# Altium project Moduloa_DRV.PrjPcb
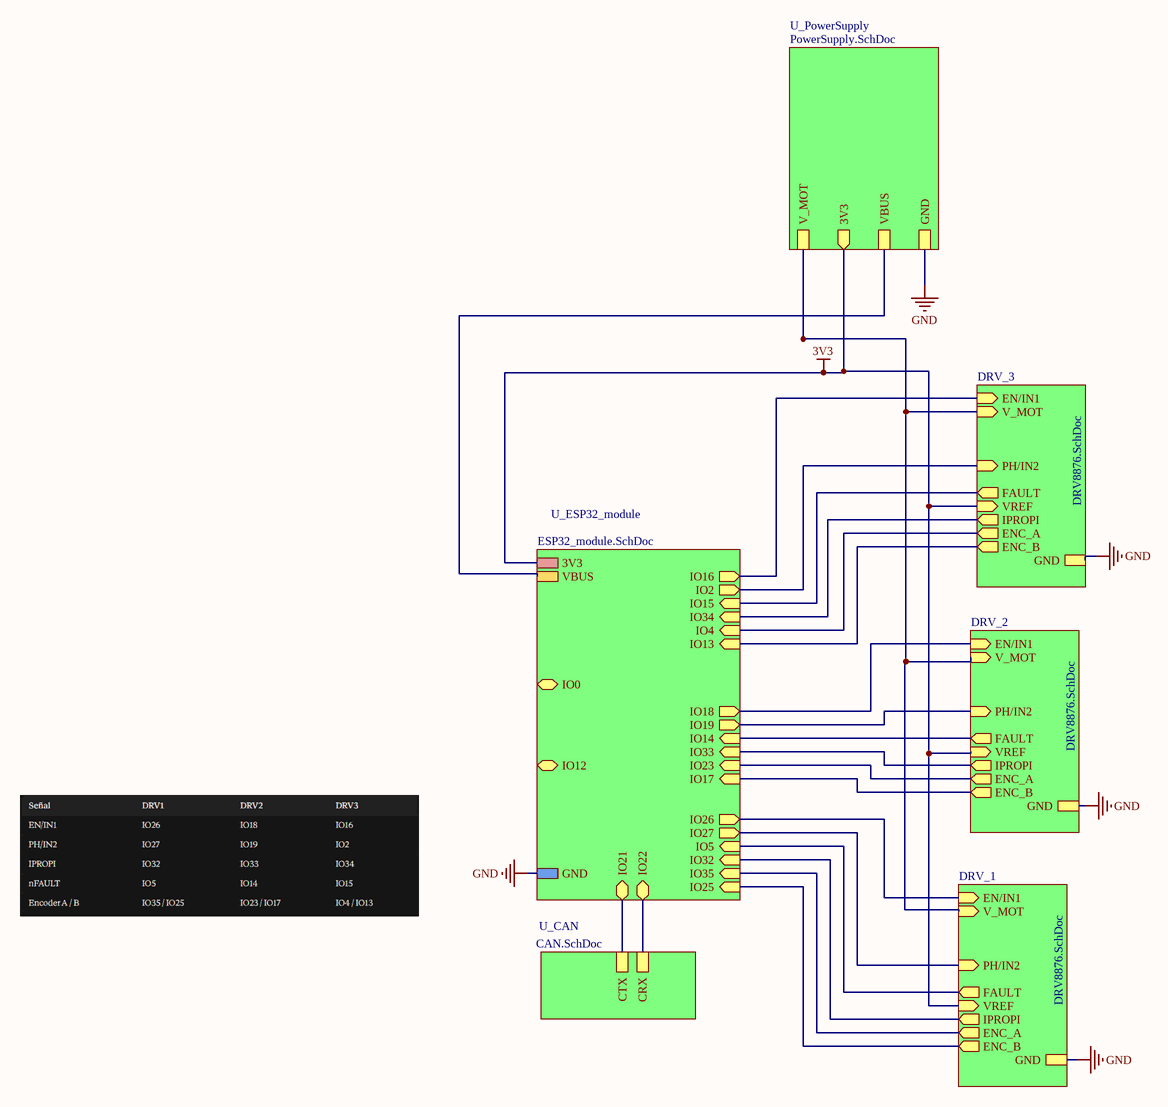
[diagram p0: MOD_DRV.SchDoc]
5 sheets, 88 parts. Net scope: hierarchical (ports join the sheet entries above them; power ports are global).
Board file: MOD_DRV.PcbDoc
Sheets:
  MOD_DRV.SchDoc
    U_ESP32_module = ESP32_module.SchDoc
    DRV_3 = DRV8876.SchDoc
    DRV_2 = DRV8876.SchDoc
    DRV_1 = DRV8876.SchDoc
    U_PowerSupply = PowerSupply.SchDoc
    U_CAN = CAN.SchDoc

## Sheet MOD_DRV.SchDoc: AAA
size 431 x 279 mm; Organization: AleskyINC; Address1: ADDRESS 1; Address2: ADDRESS 2; Address3: ADDRESS 3; Address4: ADDRESS 4; Revision: -; SheetNumber: 1; SheetTotal: 5; ENG_APP_DATE: --/--/--; DSN_APP_DATE: --/--/--; CHK_APP_DATE: --/--/--

### Sub-sheets
DRV_1 = DRV8876.SchDoc: EN/IN1 (in), PH/IN2 (in), FAULT (out), IPROPI (out), V_MOT (in), GND, VREF (in), ENC_A (out), ENC_B (out)
DRV_2 = DRV8876.SchDoc: EN/IN1 (in), PH/IN2 (in), FAULT (out), IPROPI (out), V_MOT (in), GND, VREF (in), ENC_A (out), ENC_B (out)
DRV_3 = DRV8876.SchDoc: EN/IN1 (in), PH/IN2 (in), FAULT (out), IPROPI (out), V_MOT (in), GND, VREF (in), ENC_B (out), ENC_A (out)
U_CAN = CAN.SchDoc: CTX, CRX
U_ESP32_module = ESP32_module.SchDoc: IO0 (bidir), IO2 (out), IO4 (in), IO5 (in), IO12 (bidir), IO13 (in), IO14 (in), IO15 (in), IO16 (out), IO17 (in), IO18 (out), IO19 (out), IO21 (bidir), IO22 (bidir), IO23 (in), IO25 (in), IO26 (out), IO27 (out), IO32 (in), IO34 (in), IO35 (in), 3V3, GND, VBUS, IO33 (in)
U_PowerSupply = PowerSupply.SchDoc: V_MOT, 3V3 (out), GND, VBUS

### Nets
3V3: sheet U_ESP32_module/3V3, sheet DRV_3/VREF, sheet DRV_2/VREF, sheet DRV_1/VREF, sheet U_PowerSupply/3V3
GND: sheet U_ESP32_module/GND, sheet DRV_3/GND, sheet DRV_2/GND, sheet DRV_1/GND, sheet U_PowerSupply/GND
V_MOT: sheet DRV_3/V_MOT, sheet DRV_2/V_MOT, sheet DRV_1/V_MOT, sheet U_PowerSupply/V_MOT
VBUS: sheet U_ESP32_module/VBUS, sheet U_PowerSupply/VBUS
IO2: sheet U_ESP32_module/IO2, sheet DRV_3/PH/IN2
IO4: sheet U_ESP32_module/IO4, sheet DRV_3/ENC_A
IO5: sheet U_ESP32_module/IO5, sheet DRV_1/FAULT
IO13: sheet U_ESP32_module/IO13, sheet DRV_3/ENC_B
IO14: sheet U_ESP32_module/IO14, sheet DRV_2/FAULT
IO15: sheet U_ESP32_module/IO15, sheet DRV_3/FAULT
IO16: sheet U_ESP32_module/IO16, sheet DRV_3/EN/IN1
IO17: sheet U_ESP32_module/IO17, sheet DRV_2/ENC_B
IO18: sheet U_ESP32_module/IO18, sheet DRV_2/EN/IN1
IO19: sheet U_ESP32_module/IO19, sheet DRV_2/PH/IN2
IO21: sheet U_ESP32_module/IO21, sheet U_CAN/CTX
IO22: sheet U_ESP32_module/IO22, sheet U_CAN/CRX
IO23: sheet U_ESP32_module/IO23, sheet DRV_2/ENC_A
IO25: sheet U_ESP32_module/IO25, sheet DRV_1/ENC_B
IO26: sheet U_ESP32_module/IO26, sheet DRV_1/EN/IN1
IO27: sheet U_ESP32_module/IO27, sheet DRV_1/PH/IN2
IO32: sheet U_ESP32_module/IO32, sheet DRV_1/IPROPI
IO33: sheet U_ESP32_module/IO33, sheet DRV_2/IPROPI
IO34: sheet U_ESP32_module/IO34, sheet DRV_3/IPROPI
IO35: sheet U_ESP32_module/IO35, sheet DRV_1/ENC_A

### Notes on the sheet
- DWG. NO.
- REV.
- SHT.
- THIS DOCUMENT AND THE DATA DISCLOSED HEREIN OR HEREWITH IS THE PROPERTY OF ALTIUM LIMITED AND MAY BE FREELY DISTRIBUTED IN WHOLE. NO RIGHTS ARE RESERVED OR EXPRESS OR IMPLIED WARANTEE GIVEN.
- REVISION
- DESCRIPTION
- DATE
- APPROVED
- ENG:
- APPROVALS
- PROJECT
- DSN:
- CHK:
- REFERENCE DOCUMENTS
- PROJECT REVISION:
- TITLE
- DOCUMENT REVISION:
- DESIGN ITEM:
- BOM:
- FAB DWG:
- PCB DWG:
- ASSY DWG:
- SCALE:
- SIZE
- B
- CAGE CODE
- FILE NAME
- DWG NO.
- SHEET
- OF
- REV

## Sheet ESP32_module.SchDoc
size 431 x 279 mm; Organization: ORGANIZATION; Address1: ADDRESS 1; Address2: ADDRESS 2; Address3: ADDRESS 3; Address4: ADDRESS 4; Revision: -; SheetNumber: 2; SheetTotal: 5; ENG_APP_DATE: --/--/--; DSN_APP_DATE: --/--/--; CHK_APP_DATE: --/--/--
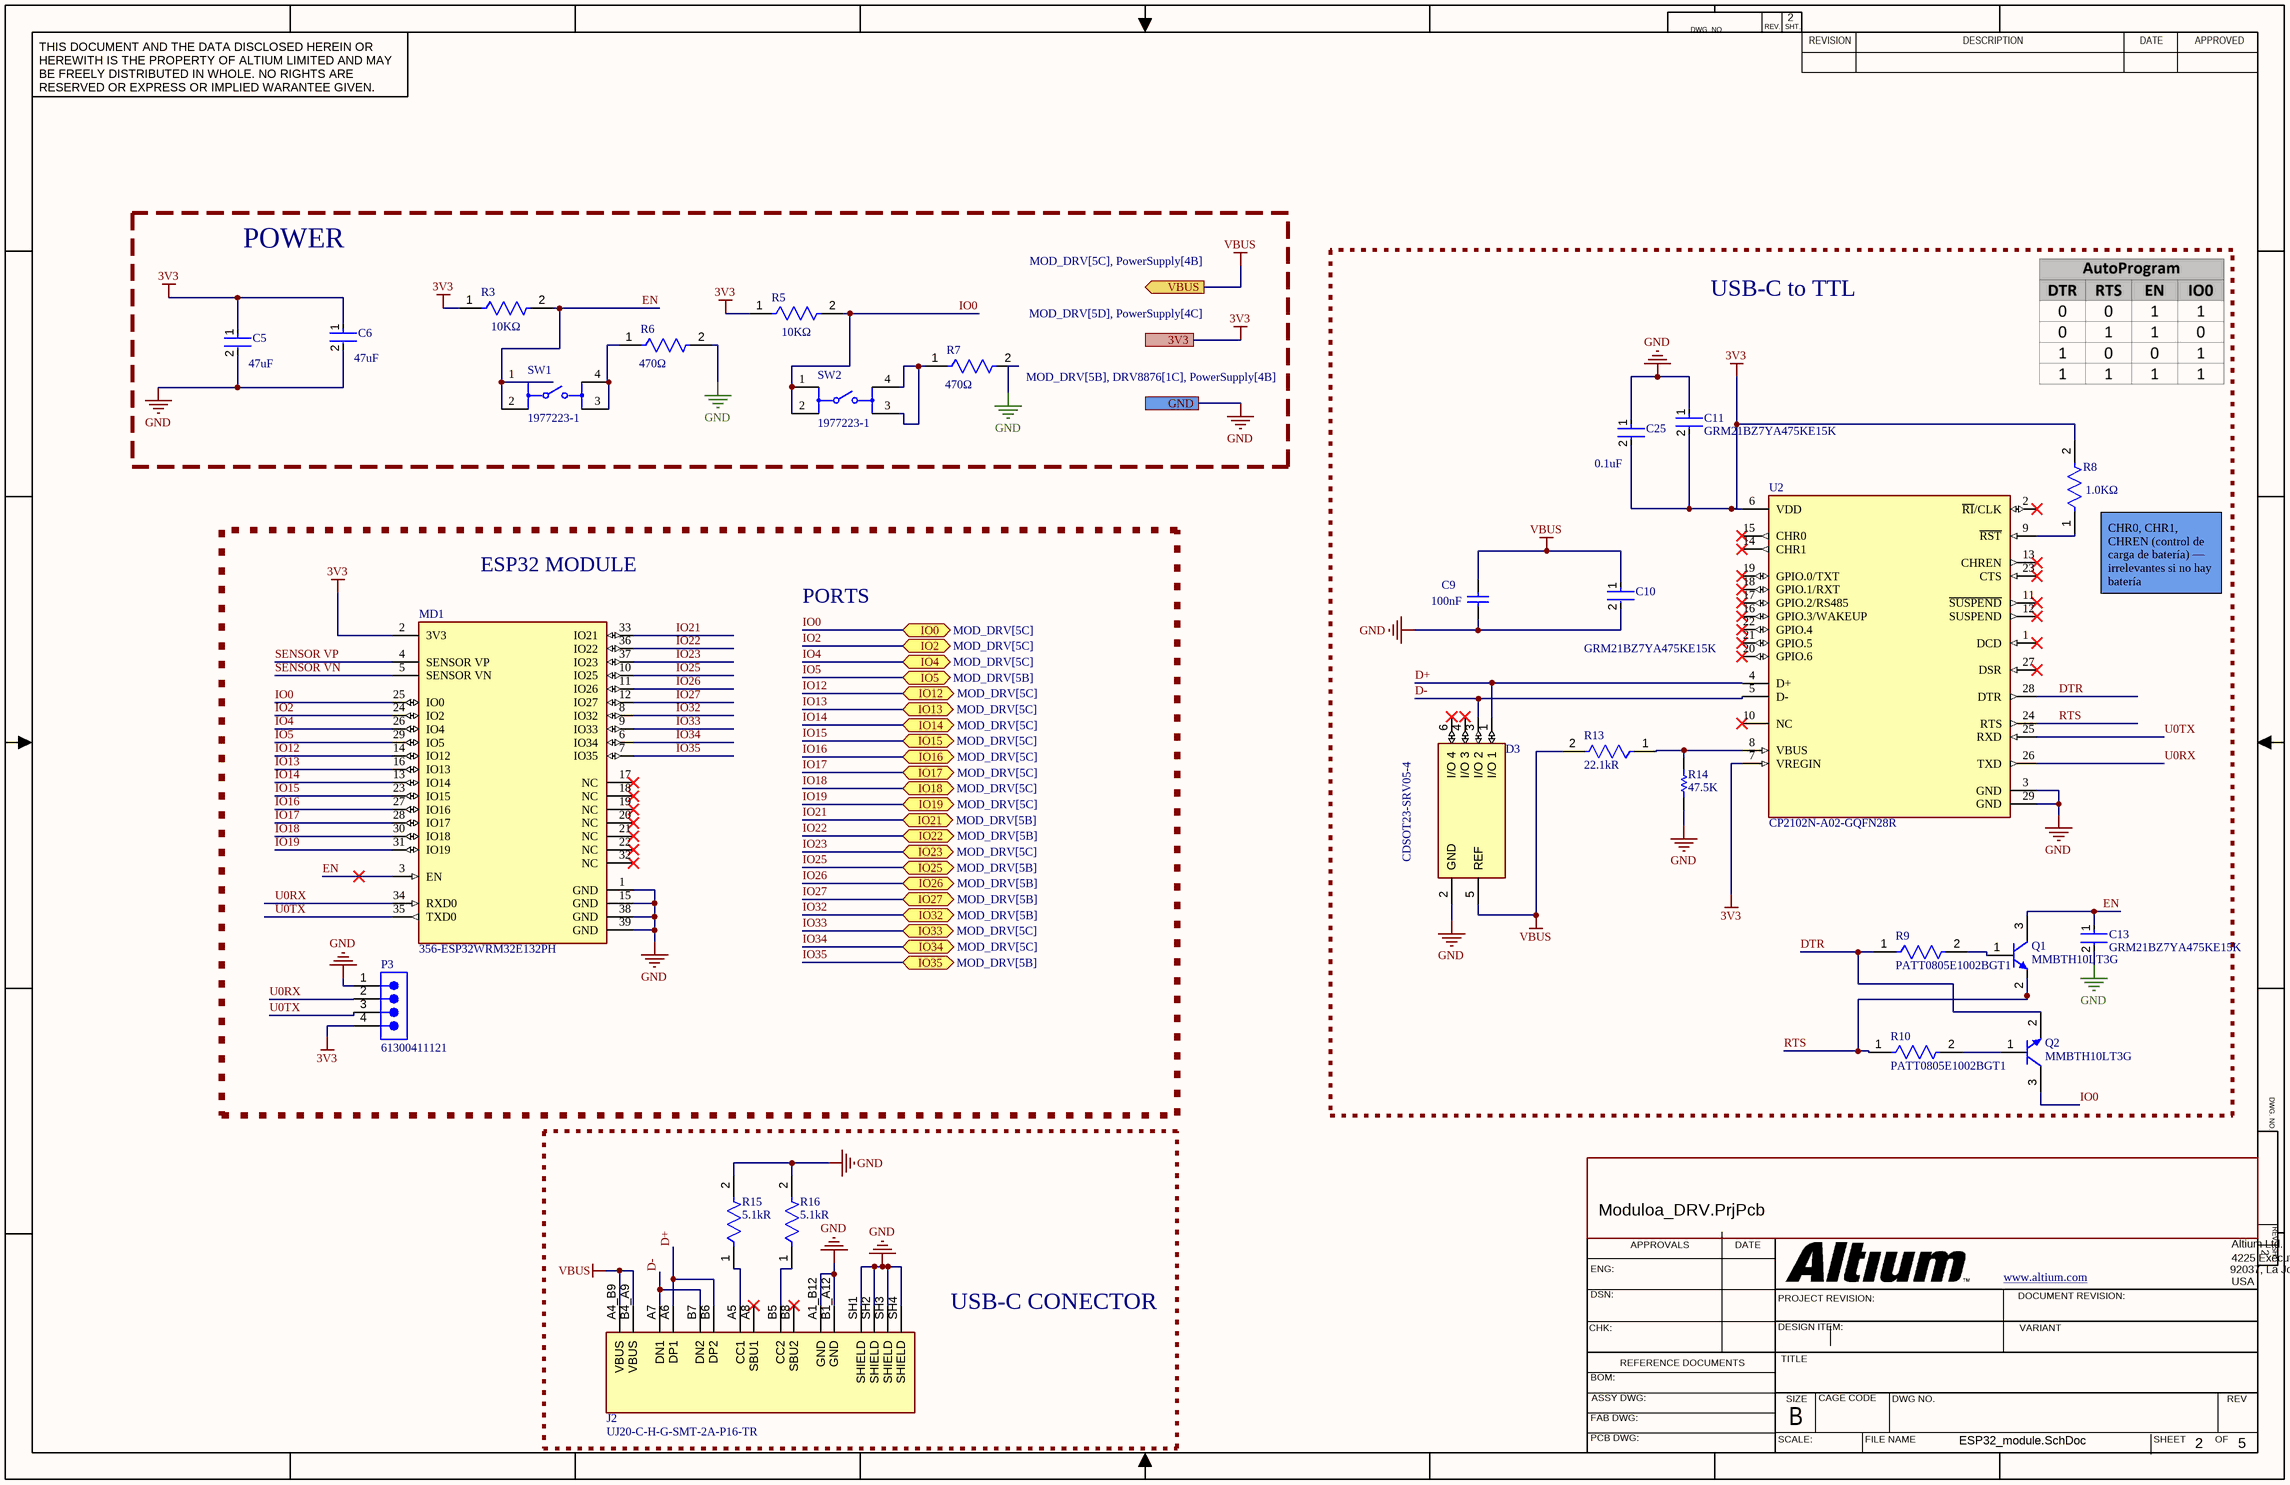
[diagram p1: ESP32_module.SchDoc]

### Parts
C5  Capacitance: 47uF  [FP-GRM31C-0_3-IPC_C]  (hidden comment: GRM31CR61E476ME44L)
C6  Capacitance: 47uF  [FP-GRM31C-0_3-IPC_C]  (hidden comment: GRM31CR61E476ME44L)
C9  100nF  [CAPC2013X145X50NL20T25]
C10  GRM21BZ7YA475KE15K  [FP-GRM21B-0_2-e0_2_0_7-IPC_A]
C11  GRM21BZ7YA475KE15K  [FP-GRM21B-0_2-e0_2_0_7-IPC_A]
C13  GRM21BZ7YA475KE15K  [FP-GRM21B-0_2-e0_2_0_7-IPC_A]
C25  Parameter 1: 0.1uF  [FP-GRM155-0_05-MFG]  (hidden comment: GRM155R71H104KE14D)
D3  CDSOT23-SRV05-4  [FP-CDSOT23-SRV05-4-MFG]
J2  UJ20-C-H-G-SMT-2A-P16-TR  [SAMESKY_UJ20-C-H-G-SMT-2A-P16-TR]
MD1  356-ESP32WRM32E132PH  [FP-ESP32-WROOM-32E_4MB-MFG]
P3  61300411121  [61300411121]
Q1  MMBTH10LT3G  [ONSC-SOT-23-3-318-08_V]
Q2  MMBTH10LT3G  [ONSC-SOT-23-3-318-08_V]
R3  value 10KΩ  [FP-RT0805-MFG]  (hidden comment: RT0805FRD0710KL)
R5  value 10KΩ  [FP-RT0805-MFG]  (hidden comment: RT0805FRD0710KL)
R6  value 470Ω  [FP-AC0805-MFG]  (hidden comment: AC0805FR-07470RL)
R7  value 470Ω  [FP-AC0805-MFG]  (hidden comment: AC0805FR-07470RL)
R8  value 1.0KΩ  [FP-RP732B-MFG]  (hidden comment: RP73D2B1K0BTDF)
R9  PATT0805E1002BGT1  [FP-PATT0805-MFG]
R10  PATT0805E1002BGT1  [FP-PATT0805-MFG]
R13  Resistance: 22.1kR  [FP-RN732A-IPC_C]  (hidden comment: RN732ATTDK2212B25)
R14  47.5K  [RESC1005X40X25NL10T10]
R15  Resistance: 5.1kR  [FP-AC0603-IPC_C]  (hidden comment: AC0603JR-075K1L)
R16  Resistance: 5.1kR  [FP-AC0603-IPC_C]  (hidden comment: AC0603JR-075K1L)
SW1  1977223-1  [FP-1977223-1-MFG]
SW2  1977223-1  [FP-1977223-1-MFG]
U2  CP2102N-A02-GQFN28R  [FP-CP2102N-A02-GQFN28R-MFG]

### Blocks framed on the sheet
POWER: C5 C6 R3 R5-R7 SW1 SW2
USB-C to TTL: C9-C11 C13 C25 D3 Q1 Q2 R8-R10 R13 R14 U2
USB-C CONECTOR: J2 R15 R16

### Ports
3V3 (see MOD_DRV[5D], PowerSupply[4C]), GND (see MOD_DRV[5B], DRV8876[1C], PowerSupply[4B]), IO0 (bidir, see MOD_DRV[5C]), IO2 (bidir, see MOD_DRV[5C]), IO4 (bidir, see MOD_DRV[5C]), IO5 (bidir, see MOD_DRV[5B]), IO12 (bidir, see MOD_DRV[5C]), IO13 (bidir, see MOD_DRV[5C]), IO14 (bidir, see MOD_DRV[5C]), IO15 (bidir, see MOD_DRV[5C]), IO16 (bidir, see MOD_DRV[5C]), IO17 (bidir, see MOD_DRV[5C]), IO18 (bidir, see MOD_DRV[5C]), IO19 (bidir, see MOD_DRV[5C]), IO21 (bidir, see MOD_DRV[5B]), IO22 (bidir, see MOD_DRV[5B]), IO23 (bidir, see MOD_DRV[5C]), IO25 (bidir, see MOD_DRV[5B]), IO26 (bidir, see MOD_DRV[5B]), IO27 (bidir, see MOD_DRV[5B]), IO32 (bidir, see MOD_DRV[5B]), IO33 (bidir, see MOD_DRV[5C]), IO34 (bidir, see MOD_DRV[5C]), IO35 (bidir, see MOD_DRV[5B]), VBUS (out, see MOD_DRV[5C], PowerSupply[4B])

### Nets
3V3: C5.1 C6.1 C11.2 C25.2 MD1.2(3V3) P3.4 R3.1 R5.1 R8.2 U2.6(VDD) U2.7(VREGIN) ; port 3V3
GND: C5.2 C6.2 C9.1 C10.2 C11.1 C13.2 C25.1 D3.2(GND) J2.A1_B12(GND) J2.B1_A12(GND) J2.SH1(SHIELD) J2.SH2(SHIELD) J2.SH3(SHIELD) J2.SH4(SHIELD) MD1.1(GND) MD1.15(GND) MD1.38(GND) MD1.39(GND) P3.1 R6.2 R7.2 R14.1 R15.2 R16.2 U2.3(GND) U2.29(GND) ; port GND
VBUS: C9.2 C10.1 D3.5(REF) J2.A4_B9(VBUS) J2.B4_A9(VBUS) R13.2 ; port VBUS
D+: D3.1(I/O_1) J2.A6(DP1) J2.B6(DP2) U2.4(D+)
D-: D3.3(I/O_2) J2.A7(DN1) J2.B7(DN2) U2.5(D-)
DTR: Q2.2(E) R9.1 U2.28(DTR)
EN: C13.1 MD1.3(EN) Q1.3(C) R3.2 SW1.1 SW1.2
IO0: MD1.25(IO0) Q2.3(C) R5.2 SW2.1 SW2.2 ; port IO0
IO2: MD1.24(IO2) ; port IO2
IO4: MD1.26(IO4) ; port IO4
IO5: MD1.29(IO5) ; port IO5
IO12: MD1.14(IO12) ; port IO12
IO13: MD1.16(IO13) ; port IO13
IO14: MD1.13(IO14) ; port IO14
IO15: MD1.23(IO15) ; port IO15
IO16: MD1.27(IO16) ; port IO16
IO17: MD1.28(IO17) ; port IO17
IO18: MD1.30(IO18) ; port IO18
IO19: MD1.31(IO19) ; port IO19
IO21: MD1.33(IO21) ; port IO21
IO22: MD1.36(IO22) ; port IO22
IO23: MD1.37(IO23) ; port IO23
IO25: MD1.10(IO25) ; port IO25
IO26: MD1.11(IO26) ; port IO26
IO27: MD1.12(IO27) ; port IO27
IO32: MD1.8(IO32) ; port IO32
IO33: MD1.9(IO33) ; port IO33
IO34: MD1.6(IO34) ; port IO34
IO35: MD1.7(IO35) ; port IO35
RTS: Q1.2(E) R10.1 U2.24(RTS)
SENSOR VN: MD1.5(SENSOR_VN)
SENSOR VP: MD1.4(SENSOR_VP)
U0RX: MD1.34(RXD0) P3.2 U2.26(TXD)
U0TX: MD1.35(TXD0) P3.3 U2.25(RXD)
NetJ2_A5: J2.A5(CC1) R15.1
NetJ2_B5: J2.B5(CC2) R16.1
NetQ1_1: Q1.1(B) R9.2
NetQ2_1: Q2.1(B) R10.2
NetR6_1: R6.1 SW1.3 SW1.4
NetR7_1: R7.1 SW2.3 SW2.4
NetR8_1: R8.1 U2.9(~{RST})
NetR13_1: R13.1 R14.2 U2.8(VBUS)

Not connected (* = marked no-connect by the designer): D3 4(I/O_3)* 6(I/O_4)*; J2 A8(SBU1)* B8(SBU2)*; MD1 17(NC)* 18(NC)* 19(NC)* 20(NC)* 21(NC)* 22(NC)* 32(NC)*; U2 1(DCD)* 2(~{RI}/CLK)* 10(NC)* 11(~{SUSPEND})* 12(SUSPEND)* 13(CHREN)* 14(CHR1)* 15(CHR0)* 16(GPIO.3/WAKEUP)* 17(GPIO.2/RS485)* 18(GPIO.1/RXT)* 19(GPIO.0/TXT)* 20(GPIO.6)* 21(GPIO.5)* 22(GPIO.4)* 23(CTS)* 27(DSR)*

### Notes on the sheet
- ESP32 MODULE
- PORTS
- (near R8) CHR0, CHR1, CHREN (control de carga de batería) — irrelevantes si no hay batería
- DWG. NO.
- REV.
- SHT.
- THIS DOCUMENT AND THE DATA DISCLOSED HEREIN OR HEREWITH IS THE PROPERTY OF ALTIUM LIMITED AND MAY BE FREELY DISTRIBUTED IN WHOLE. NO RIGHTS ARE RESERVED OR EXPRESS OR IMPLIED WARANTEE GIVEN.
- REVISION
- DESCRIPTION
- DATE
- APPROVED
- ENG:
- DSN:
- APPROVALS
- PROJECT REVISION:
- www.altium.com <http://www.altium.com>
- DOCUMENT REVISION:
- 92037, La Jolla
- USA
- Altium Ltd.
- 4225 Executive Square
- CHK:
- REFERENCE DOCUMENTS
- DESIGN ITEM:
- TITLE
- VARIANT
- BOM:
- FAB DWG:
- PCB DWG:
- ASSY DWG:
- SCALE:
- SIZE
- B
- CAGE CODE
- FILE NAME
- DWG NO.
- SHEET
- OF
- REV

### Library data of the parts
C5 C6 = CMP-06035-000147-1: CAP CER 47UF 25V X5R 1206-GRM31CR61E476ME44L; Tolerance: 20%; Width: 1.6mm; Dielectric: X5R; Thickness: 1.6mm; Length: 3.2mm; Voltage Rating (DC): 25V
C9 = CMP-2007-01227-1: C0805S104K5RACTU; Manufacturer: Kemet; Part Number: C0805S104K5RACTU
C10 = CMP-06035-048385-1: Chip Multilayer Ceramic Capacitors for General Purpose, 0805, 4.7uF, X7R, 15%, 10%, 35V. GRM21BZ7YA475KE15K
C11 = CMP-06035-048385-1: Chip Multilayer Ceramic Capacitors for General Purpose, 0805, 4.7uF, X7R, 15%, 10%, 35V-GRM21BZ7YA475KE15K
C13 = CMP-06035-048385-1: Chip Multilayer Ceramic Capacitors for General Purpose, 0805, 4.7uF, X7R, 15%, 10%, 35V
C25 = CMP-06035-062118-1: Chip Multilayer Ceramic Capacitors for General Purpose, 0402, 0.10uF, X7R, 15%, 20%, 50V; RoHS Compliant: Yes
D3 = CMP-07401-000007-1: TVS DIODE 5V 15V SOT23-6; Manufacturer: Bourns Inc.; Standoff Height: 0.2mm; Direction: Bidirectional; Peak Pulse Power: 500W; Max Junction Temp: +150°C; Number Of Channels: 4; Breakdown Voltage: 6V; Peak Pulse Current: 30A; Temperature Range High: +150°C; RoHS: TRUE; Category: Diode; Clamping Voltage: 15V; Reverse Standoff Voltage: 5V; Manufacturer Part Number: CDSOT23-SRV05-4; Octopart: https://octopart.com/cdsot23-srv05-4-bourns-1679449; Automotive: No; ComponentLink2URL: https://www.bourns.com/docs/Product-Datasheets/CDSOT23-SRV05-4.pdf; Device Class L1: Circuit Protection; Temperature: -55°C to +150°C; Device Class L2: TVS Diodes; Temperature Range Low: -55°C; Lead Free: Yes; Device Class L3: unset; Height: 1.45mm; Package: CDSOT23-SRV05-4; Ipc Land Pattern Name: SOT95P280X118-6; Mouser Description: CDSOT23-SRV05-4, Quad Uni-Directional TVS Diode, 500W, 6-Pin SOT-23; ComponentLink2Description: Datasheet; Digikey Description: TVS DIODE 5V 15V SOT23-6
MD1 = CMP-194065-000026-1: RX TXRX MOD WIFI TRACE ANT SMD
P3 = CMP-1502-01064-4: THT Vertical Pin Header WR-PHD, Pitch 2.54 mm, Single Row, 4 pins; Connector Type: Male Pin; Gender: Male; Current Rating: 3A; Number of Positions: 4; Operating Supply Voltage: 250V; Contact Resistance: 20mΩ; Pitch: 2.54mm; Max Operating Temperature: 105°C; Mount: Through Hole; Contact Material: Gold; Contact Plating: Gold; Number of Contacts: 4; Orientation: Vertical; Packaging: Bulk; Contact Mating Length: 5.9944mm; Voltage Rating: 250V; Number of Rows: 1; Height: 8.89mm; Lead Free: Lead Free; Lead Pitch: 2.54mm; Number of Pins: 4; Color: Black; Min Operating Temperature: -40°C; RoHS: Compliant; Termination: Solder
Q1 Q2 = CMP-1048-00599-1: VHF / UHF Transistor, NPN Silicon, 3-Pin SOT-23, Pb-Free, Tape and Reel; Manufacturer: On Semiconductor; fT Min (MHz): 650; Packing: Tape and Reel; ComponentLink3Description: Package Specification; PartNumber: MMBTH10LT3G; DatasheetVersion: Rev. 5; Polarity: NPN; ComponentLink2Description: Datasheet; ComponentLink1Description: Manufacturer URL; PackageVersion: Rev. AP, 11/2009; ComponentLink1URL: http://www.onsemi.com/; ComponentLink2URL: http://www.onsemi.cn/pub_link/Collateral/MMBTH10LT1-D.PDF; PackageReference: SOT-23-3-318-08; RoHS: TRUE; Mounting Technology: Surface Mount; ComponentLink3URL: http://www.onsemi.cn/pub_link/Collateral/318-08.PDF; PackageDescription: 3-Pin Small Outline Transistor, Body 2.92 x 1.3 mm, Pitch 0.95 mm
R3 R5 = CMP-03412-035478-1: RES SMD 10K OHM 1% 1/8W 0805; Manufacturer: Yageo; Tolerance: 0.0001; Temperature Coefficient: 25 ppm/°C; Power Rating: 0.125W; Voltage Rating: 150V; RoHS: TRUE; Footprint Url: http://www.yageo.com/exep/pages/download/literatures/PYu-R_Mount_10.pdf; Series: RT; Octopart: https://octopart.com/rt0805frd0710kl-yageo-71399701; Digikey Description: RES SMD 10K OHM 1% 1/8W 0805; Composition: Thin Film; Manufacturer Part Number: RT0805FRD0710KL; Device Class L1: Passive Components; Automotive: No; ComponentLink2Description: Datasheet; Ipc Land Pattern Name: RESC200125X50; Device Class L2: Resistors; Resistance: 10KΩ; Temperature Range Low: -55°C; Device Class L3: Chip SMD Resistors; ComponentLink2URL: http://www.yageo.com/documents/recent/PYu-RT_1-to-0.01_RoHS_L_9.pdf; Temperature: -55°C to +155°C; Category: Res; Temperature Range High: +155°C; Lead Free: Yes; Package: RT0805; Height: 0.6mm
R6 R7 = CMP-03412-037267-1: RES SMD 470 OHM 1% 1/8W 0805; Manufacturer: Yageo; Automotive Grade: Grade 0; Tolerance: 0.01; Voltage Rating: 150V; Package: AC0805; Device Class L3: Chip SMD Resistors; Composition: Thick Film; Ipc Land Pattern Name: RESC200125X50; Height: 0.6mm; Device Class L1: Passive Components; Series: AC; Resistance: 470Ω; RoHS: TRUE; Automotive: Yes; ComponentLink2Description: Datasheet; Power Rating: 1/8W; Temperature Range Low: -55°C; Category: Res; Digikey Description: RES SMD 470 OHM 1% 1/8W 0805; Temperature: -55°C to +155°C; ComponentLink2URL: http://www.yageo.com/documents/recent/PYu-AC_51_RoHS_L_6.pdf; Manufacturer Part Number: AC0805FR-07470RL; Mouser Description: Thick Film Resistors 1/8W 470ohm 1% AEC-Q200; Lead Free: Yes; Temperature Range High: +155°C; Device Class L2: Resistors; Octopart: https://octopart.com/ac0805fr-07470rl-yageo-26633242; Footprint Url: http://www.yageo.com/exep/pages/download/literatures/PYu-R_Mount_10.pdf
R8 = CMP-03211-010976-1: Res Thin Film 1206 1.0KΩ 0.1% 0.25W 15ppm/°C Molded SMD; Manufacturer: TE Connectivity; Voltage Rating: 200V; Lead Free: Yes; RoHS: TRUE; Category: Res; Tolerance: 0.1%; Octopart: https://octopart.com/rp73d2b1k0btdf-te+connectivity-22741139; packaging: 1000 Reel; Device Class L2: Resistors; Power Rating: 0.25W; Device Class L1: Passive Components; Device Class L3: Chip SMD Resistors; Temperature Range Low: -55°C; Package: RP732B; Series: RP73; Height: 0.65mm; Composition: Thin Film; Temperature Range High: 155°C; Automotive: No; Temperature Coefficient: 15ppm/°C; octopart_url: https://octopart.com/rp73d2b1k0btdf-te+connectivity-22741139; Temperature: -55°C to 155°C; Ipc Land Pattern Name: RESC305155X55; ComponentLink2Description: Datasheet; Resistance: 1.0KΩ; Manufacturer Part Number: RP73D2B1K0BTDF; ComponentLink2URL: https://www.te.com/commerce/DocumentDelivery/DDEController?Action=showdoc&DocId=Data+Sheet%7F1773272%7FL%7Fpdf%7FEnglish%7FENG_DS_1773272_L.pdf%7F8-1879255-6
R9 R10 = CMP-02407-000039-1: RES SMD 10K OHM 0.1% 1/5W 0805; Manufacturer: Vishay; Resistance: 10kΩ; Value: 10kΩ; Automotive Grade: Grade 0; Temperature Coefficient: 25ppm/°C; Power Rating: 200mW; Voltage Rating: 100V; Category: Res; RoHS: TRUE; Tolerance: 0.1%; Digikey Description: RES SMD 10K OHM 0.1% 1/5W 0805; Height: 0.018inch; Automotive: Yes; Package: PATT0805; Manufacturer Part Number: PATT0805E1002BGT1; Octopart: https://octopart.com/patt0805e1002bgt1-vishay-34963131; Device Class L3: Chip SMD Resistors; Temperature Range High: +250°C; Series: PATT; Temperature: -55°C to +250°C; ComponentLink2URL: http://www.vishay.com/docs/60124/patt.pdf; Ipc Land Pattern Name: RESC203127X38; Composition: Thin Film; Device Class L2: Resistors; Temperature Range Low: -55°C; Lead Free: Yes; ComponentLink2Description: Datasheet; Footprint Url: http://www.vishay.com/docs/60119/landpatterns.pdf; Device Class L1: Passive Components
R13 = CMP-04015-002277-1: 22.1kΩ ±0.1% 0.1W, 1/10W Chip Resistor 0805 (2012 Metric) Moisture Resistant Thin Film; Power Rating: 100mW; Temperature Coefficient: 25ppm/°C; Voltage Rating (DC): 100V; Length: 2mm; Max Operating Temperature: 125°C; Packaging: Tape and Reel; Tolerance: 0.1%; Case/Package: 0805; Height: 0.5mm; Weight: 0.000194oz; Termination: SMD/SMT; Composition: Thin Film; Case Code (Imperial): 0805; Width: 1.2mm; Case Code (Metric): 2012; Voltage Rating: 100V; Min Operating Temperature: -55°C
R14 = CMP-2002-06222-1: MC00625W0402147K5; Manufacturer: Multicomp; Part Number: MC00625W0402147K5
R15 R16 = CMP-03412-043833-1: RES 5.1kΩ 5.00% 0.1W 0603; Power Rating: 100mW; Temperature Coefficient: 100ppm/°C; Tolerance: 5%; Voltage Rating: 50V; Width: 0.8mm; Case Code (Imperial): 0603; Packaging: Tape and Reel; Number of Terminations: 2; Termination: SMD/SMT; Lead Free: Lead Free; RoHS Compliant: Yes; Min Operating Temperature: -55°C; Case Code (Metric): 1608; Resistor Type: Thick Film; Case/Package: 0603; Size Code: 0603; Features: Moisture Resistant; Series: AC; Weight: 7.1E-05oz; Height: 0.022inch; Max Operating Temperature: 155°C; Max Power Dissipation: 100mW; Length: 0.063inch
SW1 SW2 = CMP-03790-42203485-1: 1977223-1 Pushbutton Switch, SPST, Momentary, 0.05A, 24VDC, Solder Terminal, Panel Mount; Manufacturer Lifecycle Status: ACTIVE; Switch Function: Off-Mom; Illumination Type: Illuminated, Non-Illuminated; Max Voltage Rating (DC): 24V; Switch Travel: 250µm; Number of Positions: 2; Contact Current Rating: 50mA; Mechanical Life: 1Mcycles; Actuator Length: 700µm; Actuator Material: Nylon, Polyamide; Max Operating Temperature: 105°C; Packaging: Bulk; Type: Switch; Material: Polyamide; Termination: Gull Wing; Voltage Rating (DC): 24V; Height: 4.3mm; NexarPartId: 42203485; Contact Plating: Silver; Lifecycle Status: Production; RoHS: Compliant; Radiation Hardening: No; Case/Package: SMD/SMT; Throw Configuration: SPST; REACH SVHC: No SVHC; Current Rating: 50mA; Mount: Surface Mount; Min Operating Temperature: -40°C; Housing Material: Polyphenylene; ELV: Compliant
U2 = CMP-08093-000007-1: IC USB TO UART BRIDGE QFN28
J2 = UJ20-C-H-G-SMT-2A-P16-TR: Package: None; Price: None; Value: *; MP: UJ20-C-H-G-SMT-2A-P16-TR; Availability: Unavailable

## Sheet DRV8876.SchDoc: FOC_driver
size A4; Author: Alesky Alcarraz Jaime; Revision: 1.0; SheetNumber: 5; SheetTotal: 5
Used 3 times, as channels DRV_3, DRV_2, DRV_1. Parts and nets are listed once, with the designators drawn on the sheet.
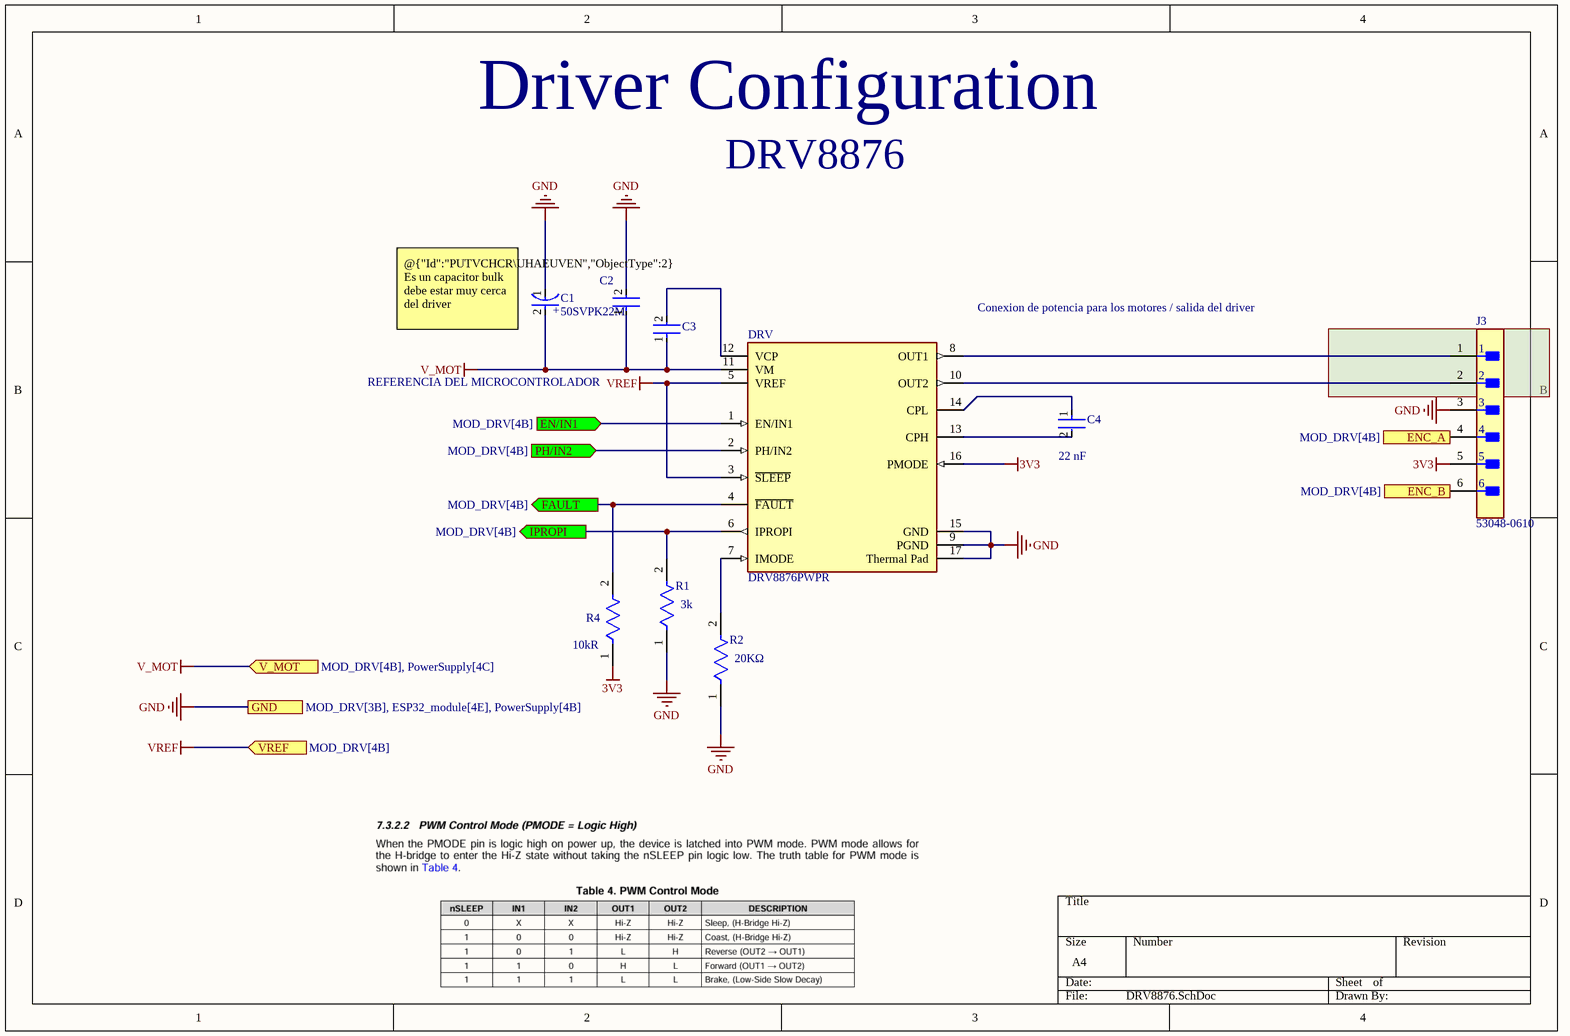
[diagram p2: DRV8876.SchDoc]

### Parts
C1  50SVPK22M  [FP-OS-CON-SMT-C6-MFG]
C2  TMK316SD104KL-T  [FP-1206-L_3_2_0_15-W_1_6-IPC_C]  (value not drawn)
C3  CC0402MRX5R7BB104  [FP-CC0402-IPC_C]  (value not drawn)
C4  value 22 nF  [FP-CC0402-MFG]  (hidden comment: CC0402KRX5R8BB223)
DRV  DRV8876PWPR  [FP-PWP0016C-IPC_C]
J3  53048-0610  [FP-53048-0610-MFG]
R1  Parameter 1: 3k  [FP-RN73R1J-IPC_A]  (hidden comment: RN73R1JTTD3001F50)
R2  value 20KΩ  [FP-RT0603-MFG]  (hidden comment: RT0603DRD0720KL)
R4  Resistance: 10kR  [FP-RK73H1J-IPC_C]  (hidden comment: RK73H1JLTDD1002F)

### Ports
EN/IN1 (in, see MOD_DRV[4B]), ENC_A (out, see MOD_DRV[4B]), ENC_B (out, see MOD_DRV[4B]), FAULT (out, see MOD_DRV[4B]), GND (see MOD_DRV[3B], ESP32_module[4E], PowerSupply[4B]), IPROPI (out, see MOD_DRV[4B]), PH/IN2 (in, see MOD_DRV[4B]), V_MOT (in, see MOD_DRV[4B], PowerSupply[4C]), VREF (in, see MOD_DRV[4B])

### Nets
3V3: DRV.16(PMODE) J3.5 R4.1
GND: C1.1(C) C2.2 DRV.9(PGND) DRV.15(GND) DRV.17(Thermal_Pad) J3.3 R1.1 R2.1 ; port GND
V_MOT: C1.2(A) C2.1 C3.1 DRV.11(VM) ; port V_MOT
VREF: DRV.3(~{SLEEP}) DRV.5(VREF) ; port VREF
EN/IN1: DRV.1(EN/IN1) ; port EN/IN1
ENC_A: J3.4 ; port ENC_A
ENC_B: J3.6 ; port ENC_B
FAULT: DRV.4(~{FAULT}) R4.2 ; port FAULT
IPROPI: DRV.6(IPROPI) R1.2 ; port IPROPI
PH/IN2: DRV.2(PH/IN2) ; port PH/IN2
NetC3_2: C3.2 DRV.12(VCP)
NetC4_1: C4.1 DRV.14(CPL)
NetC4_2: C4.2 DRV.13(CPH)
NetDRV_7: DRV.7(IMODE) R2.2
NetDRV_8: DRV.8(OUT1) J3.1
NetDRV_10: DRV.10(OUT2) J3.2

### Channels
DRV_3: designators C1=C1C C2=C2C C3=C3C C4=C4C DRV=DRVC J3=EncoderC R1=R1C R2=R2C R4=R4C; ports EN/IN1=IO16 ENC_A=IO4 ENC_B=IO13 FAULT=IO15 GND=GND IPROPI=IO34 PH/IN2=IO2 V_MOT=V_MOT VREF=3V3
DRV_2: designators C1=C1B C2=C2B C3=C3B C4=C4B DRV=DRVB J3=EncoderB R1=R1B R2=R2B R4=R4B; ports EN/IN1=IO18 ENC_A=IO23 ENC_B=IO17 FAULT=IO14 GND=GND IPROPI=IO33 PH/IN2=IO19 V_MOT=V_MOT VREF=3V3
DRV_1: designators C1=C1A C2=C2A C3=C3A C4=C4A DRV=DRVA J3=EncoderA R1=R1A R2=R2A R4=R4A; ports EN/IN1=IO26 ENC_A=IO35 ENC_B=IO25 FAULT=IO5 GND=GND IPROPI=IO32 PH/IN2=IO27 V_MOT=V_MOT VREF=3V3

### Notes on the sheet
- Driver Configuration
- DRV8876
- Conexion de potencia para los motores / salida del driver
- REFERENCIA DEL MICROCONTROLADOR
- (near C1) @{"Id":"PUTVCHCR\UHAEUVEN","ObjectType":2} Es un capacitor bulk debe estar muy cerca del driver
- (in symbol CMP-05428-000935-1) +

### Library data of the parts
C1 = CMP-05428-000935-1: Conductive Polymer Aluminum Solid Capacitors (OS-CON) 22uF ±20% 50V; ESR (Equivalent Series Resistance): 35mR; Life (Hours): 1000Hour; RoHS Compliant: Yes; Max Operating Temperature: 125°C; Min Operating Temperature: -55°C; Capacitance: 22uF; Case/Package: Radial; Packaging: Cut Tape; Voltage Rating: 50V; Mount: Surface Mount; Series: OS-CON™, SVPK; Tolerance: 20%
C2 = CMP-14477-003553-3: Ceramic Capacitor, 1206, 0.1uF, 10%, 25V; NexarPartId: 198412; Capacitance: 100nF; Packaging: Cut Tape; Termination: SMD/SMT; Voltage Rating: 25V; REACH SVHC: Unknown; Case/Package: 1206; Material: Ceramic; Max Width: 1.75mm; Case Code (Imperial): 1206; RoHS: Compliant; Max Thickness: 1.8mm; Min Thickness: 1.4mm; Max Length: 3.35mm; Min Length: 3.05mm; Lead Free: Lead Free; Thickness: 1.8034mm; Number of Pins: 2; Mount: Surface Mount; Dielectric Material: Ceramic; Height: 1.8mm; Composition: Ceramic; Width: 1.6mm; Min Width: 1.45mm; Halogen Free: Halogen Free; Tolerance: 10%; Voltage Rating (DC): 25V; Min Operating Temperature: -55°C; Max Operating Temperature: 125°C; Case Code (Metric): 3216; Depth: 1.6mm; Length: 3.2mm; Voltage: 25V
C3 = CMP-03422-001312-1: CAP CER 0.1UF 16V X5R 0402; Manufacturer: YAGEO; Value: 100 nF; Automotive Grade: NA; Material: Ceramic; Tolerance: 0.2; Temperature Coefficient: 30ppm/°C; Temperature: -55°C to +125°C; Footprint Url: http://www.yageo.com/exep/pages/download/literatures/UPY-C_GEN_24.pdf; Height: 0.55mm; Ipc Land Pattern Name: CAPC10050X50; Digikey Description: CAP CER 0.1UF 16V X5R 0402; Device Class L2: Capacitors; Mouser Description: Multilayer Ceramic Capacitors MLCC - SMD/SMT 100nF 16V X5R 20%; Octopart: https://octopart.com/cc0402mrx5r7bb104-yageo-33242280; ComponentLink2Description: Datasheet; Temperature Range Low: -55°C; Manufacturer Part Number: CC0402MRX5R7BB104; RoHS: TRUE; Device Class L3: Ceramic Capacitors; Automotive: No; Temperature Characteristic: X5R; Temperature Range High: +125°C; Device Class L1: Passive Components; Package: CC0402; Lead Free: Yes; Voltage Rating: 16 V; Category: Cap; Capacitance: 100 nF; ComponentLink2URL: http://www.yageo.com/documents/recent/UPY-GP_NP0_16V-to-50V_16.pdf
C4 = CMP-03422-000870-1: CC0402 22 nF X5R 10.00% 25 V; Manufacturer: YAGEO; Temperature Coefficient: 30ppm/°C; Material: Ceramic; Tolerance: 0.1; Voltage Rating: 25 V; Automotive Grade: NA; Automotive: No; Temperature Range Low: -55°C; ComponentLink2Description: Datasheet; Ipc Land Pattern Name: CAPC10050X50; Device Class L2: Capacitors; Device Class L3: Ceramic Capacitors; Capacitance: 22 nF; Lead Free: Yes; ComponentLink2URL: http://www.yageo.com/documents/recent/UPY-GP_NP0_16V-to-50V_16.pdf; RoHS: TRUE; Height: 0.55mm; Package: CC0402; Device Class L1: Passive Components; Category: Cap; Temperature: -55°C to +125°C; Manufacturer Part Number: CC0402KRX5R8BB223; Temperature Range High: +125°C; Octopart: https://octopart.com/cc0402krx5r8bb223-yageo-88496716; Footprint Url: http://www.yageo.com/exep/pages/download/literatures/UPY-C_GEN_24.pdf; Temperature Characteristic: X5R
DRV = CMP-04915-000007-1: PWR MGMT MOTOR/FAN DRIVER
J3 = CMP-2000-05632-2: CONN HEADER R/A 6POS 1.25MM; Number of Positions: 6; Glow Wire Compliant: Non-compliant; Max Voltage Rating (AC): 250V; Contact Resistance: 20mR; Voltage Rating: 125V; Current Rating: 1A; Insulation Resistance: 100MR; Max Current Rating: 3A; Gender: Male; RoHS Compliant: Yes; Color: Natural; Pitch: 1.25mm; Termination: Solder; Orientation: Right Angle; Max Operating Temperature: 85°C; Contact Plating: Tin; Series: PicoBlade; Housing Material: Nylon; Number of Rows: 1; Height: 6.99mm; Mount: Through Hole; Flammability Rating: UL94 V-0; Voltage Rating (DC): 125V; Number of Contacts: 6; Contact Material: Bronze; Lead Free: Lead Free; Depth: 5.5mm; Number of Circuits: 6; Contact Type: Blade Pin; Package Quantity: 2000; Packaging: Tray; Min Operating Temperature: -40°C; Radiation Hardening: No; Housing Color: Natural
R1 = CMP-04015-029754-1: 3kΩ ±1% 0.1W, 1/10W Chip Resistor 0603 (1608 Metric) Moisture Resistant Thin Film / RN73R1JTTD3001F50
R2 = CMP-2000-04568-2: RES SMD 20K OHM 0.5% 1/10W 0603 / RT0603DRD0720KL; Manufacturer: Yageo; Power Rating: 0.1W; Temperature Coefficient: 25 ppm/°C; Voltage Rating: 75V; Tolerance: 0.005; Ipc Land Pattern Name: RESC16080X45; Footprint Url: http://www.yageo.com/exep/pages/download/literatures/PYu-R_Mount_10.pdf; Lead Free: Yes; Height: 0.55mm; Temperature Range High: +155°C; Manufacturer Part Number: RT0603DRD0720KL; Package: RT0603; Temperature: -55°C to +155°C; RoHS: TRUE; Composition: Thin Film; Category: Res; Digikey Description: RES SMD 20K OHM 0.5% 1/10W 0603; Series: RT; Automotive: No; Device Class L1: Passive Components; Device Class L2: Resistors; ComponentLink2Description: Datasheet; Resistance: 20KΩ; Device Class L3: Chip SMD Resistors; Temperature Range Low: -55°C; Octopart: https://octopart.com/rt0603drd0720kl-yageo-1224030; ComponentLink2URL: http://www.yageo.com/documents/recent/PYu-RT_1-to-0.01_RoHS_L_9.pdf
R4 = CMP-04015-089147-1: 10kΩ ±1% 0.1W Chip Resistor 0603 Thick Film AEC-Q200 Qualified / RK73H1JLTDD1002F; Power Rating: 100mW; Temperature Coefficient: 100ppm/°C; Voltage Rating: 50V; Military Standard: Not; Packaging: Tape and Reel; RoHS Compliant: No; Lead Free: Contains Lead; Max Operating Temperature: 155°C; Min Operating Temperature: -55°C; Construction: Rectangular; Depth: 0.8mm; Series: RK73H; Resistor Type: Thick Film; Case Code (Metric): 1608; Length: 1.6mm; Termination: SMD/SMT; Tolerance: 1%; Case/Package: 0603; Case Code (Imperial): 0603

## Sheet PowerSupply.SchDoc
size 431 x 279 mm; Organization: ORGANIZATION; Address1: ADDRESS 1; Address2: ADDRESS 2; Address3: ADDRESS 3; Address4: ADDRESS 4; Revision: -; SheetNumber: 3; SheetTotal: 5; ENG_APP_DATE: --/--/--; DSN_APP_DATE: --/--/--; CHK_APP_DATE: --/--/--
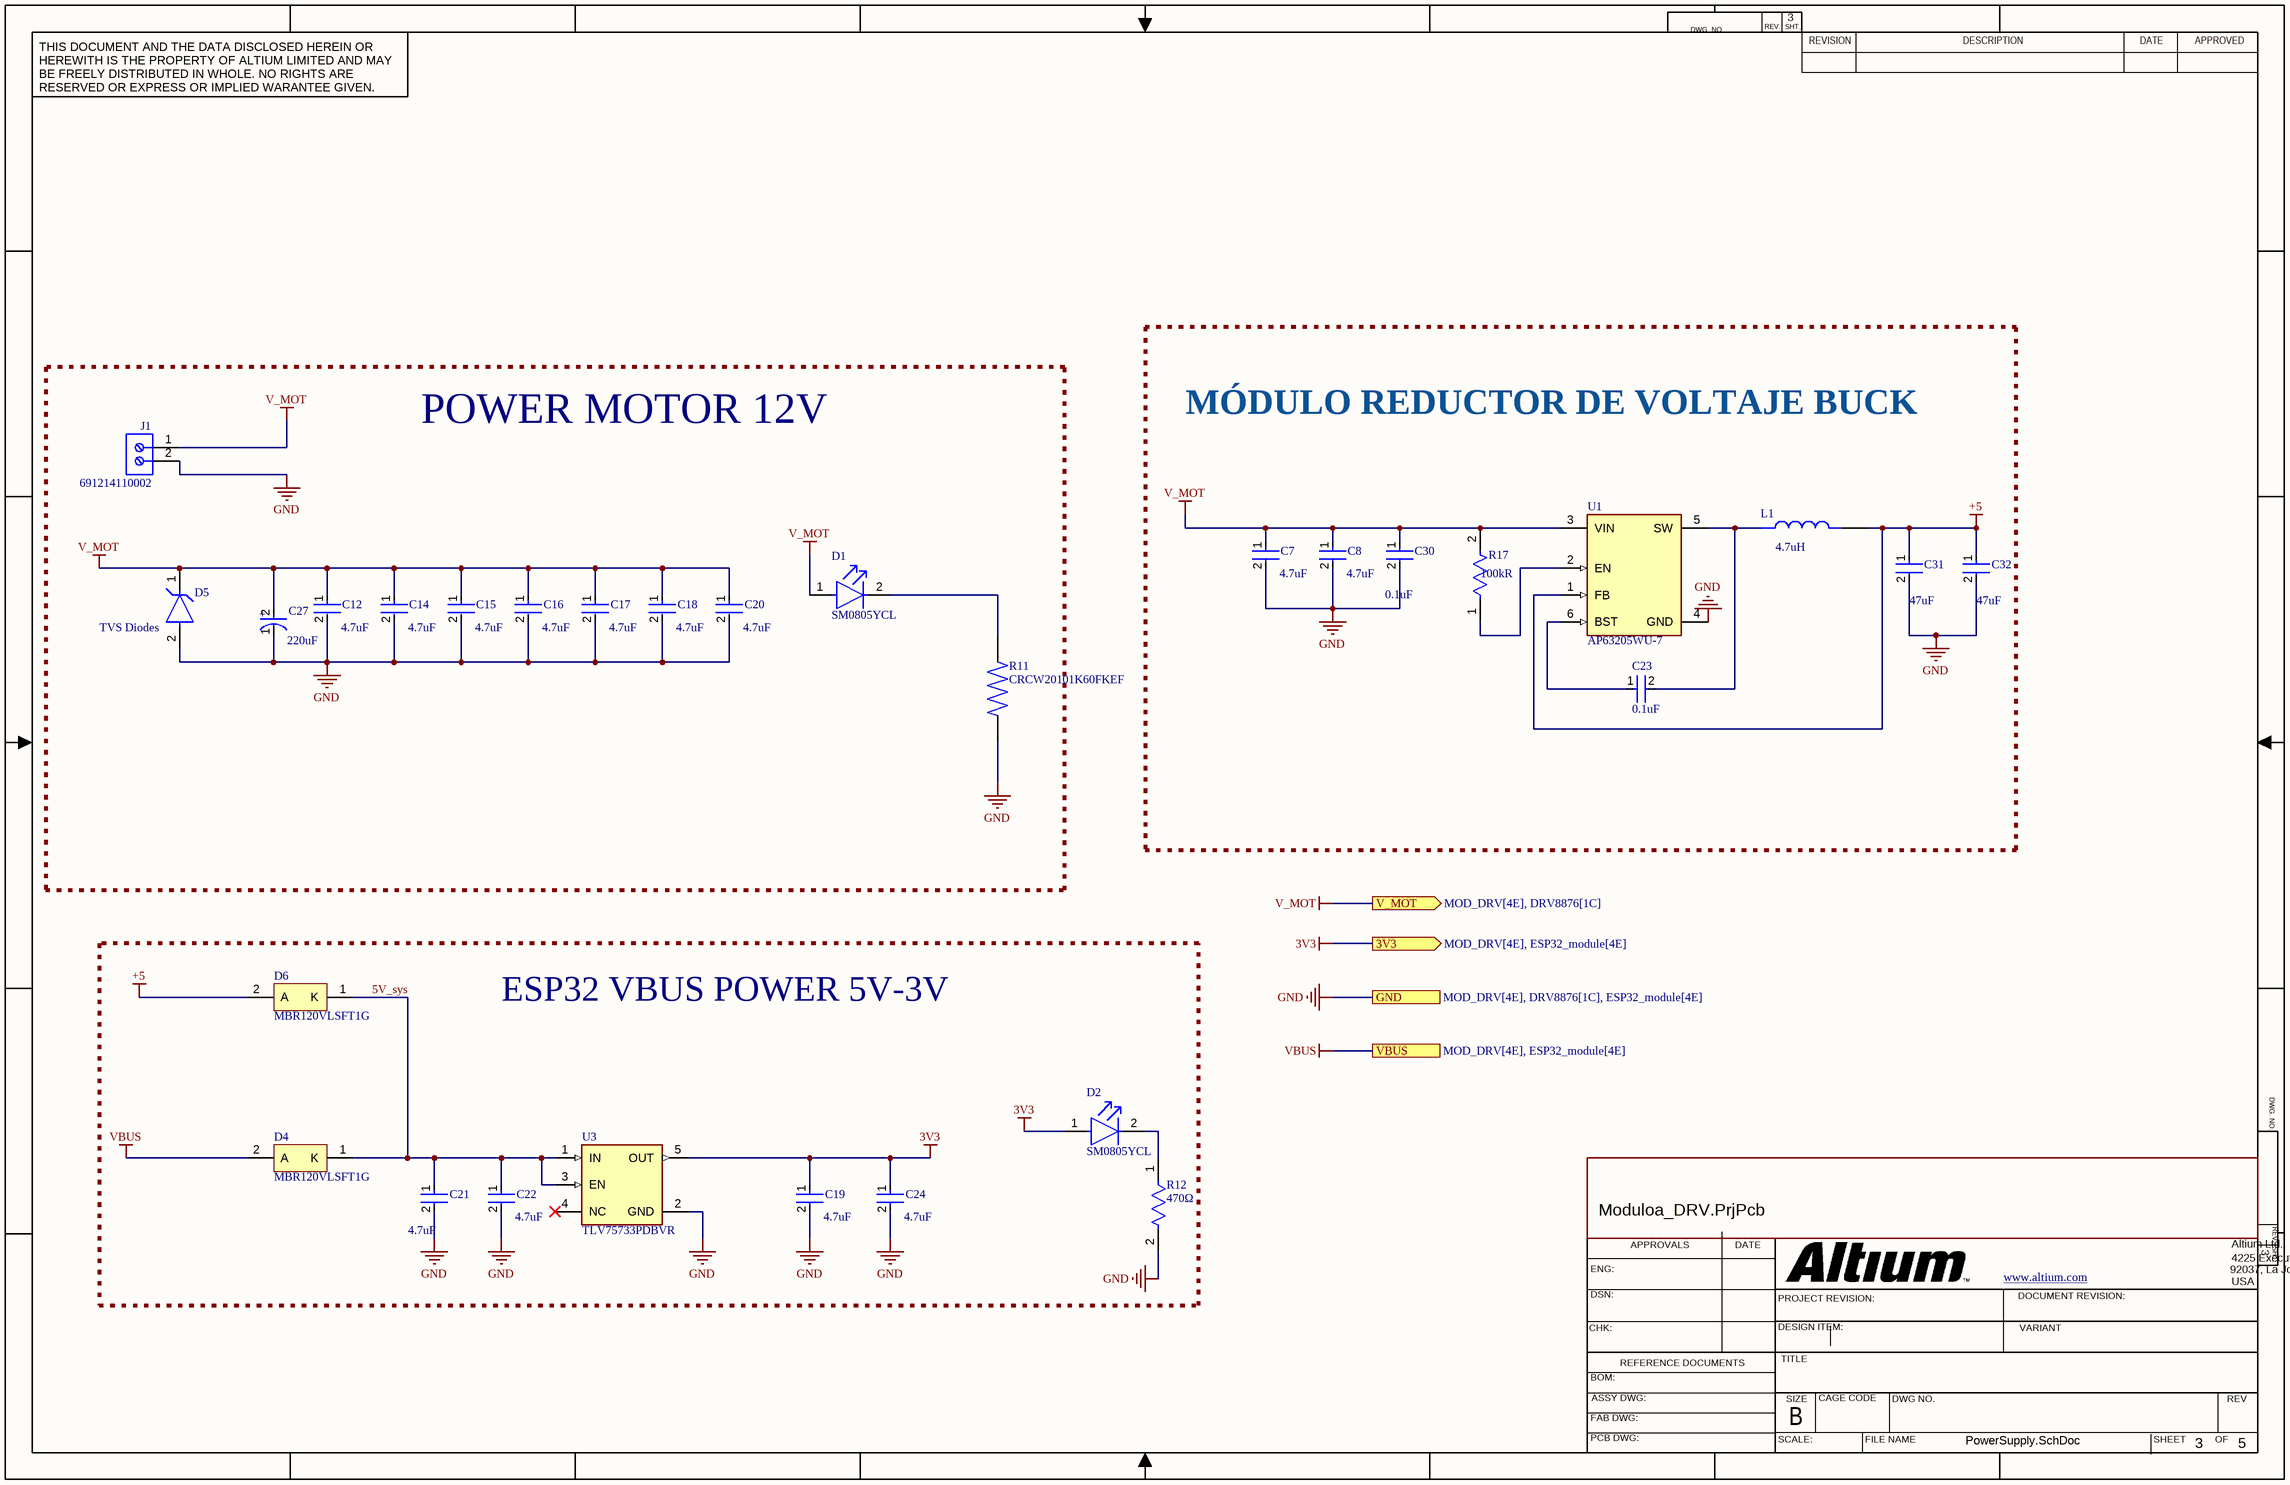
[diagram p3: PowerSupply.SchDoc]

### Parts
C7  Parameter 1: 4.7uF  [FP-GRM21B-0_2-e0_2_0_7-IPC_A]  (hidden comment: GRM21BZ7YA475KE15K)
C8  Parameter 1: 4.7uF  [FP-GRM21B-0_2-e0_2_0_7-IPC_A]  (hidden comment: GRM21BZ7YA475KE15K)
C12  Parameter 1: 4.7uF  [FP-GRM21B-0_2-e0_2_0_7-IPC_A]  (hidden comment: GRM21BZ7YA475KE15K)
C14  Parameter 1: 4.7uF  [FP-GRM21B-0_2-e0_2_0_7-IPC_A]  (hidden comment: GRM21BZ7YA475KE15K)
C15  Parameter 1: 4.7uF  [FP-GRM21B-0_2-e0_2_0_7-IPC_A]  (hidden comment: GRM21BZ7YA475KE15K)
C16  Parameter 1: 4.7uF  [FP-GRM21B-0_2-e0_2_0_7-IPC_A]  (hidden comment: GRM21BZ7YA475KE15K)
C17  Parameter 1: 4.7uF  [FP-GRM21B-0_2-e0_2_0_7-IPC_A]  (hidden comment: GRM21BZ7YA475KE15K)
C18  Parameter 1: 4.7uF  [FP-GRM21B-0_2-e0_2_0_7-IPC_A]  (hidden comment: GRM21BZ7YA475KE15K)
C19  Parameter 1: 4.7uF  [FP-GRM21B-0_2-e0_2_0_7-IPC_A]  (hidden comment: GRM21BZ7YA475KE15K)
C20  Parameter 1: 4.7uF  [FP-GRM21B-0_2-e0_2_0_7-IPC_A]  (hidden comment: GRM21BZ7YA475KE15K)
C21  Parameter 1: 4.7uF  [FP-GRM21B-0_2-e0_2_0_7-IPC_A]  (hidden comment: GRM21BZ7YA475KE15K)
C22  Parameter 1: 4.7uF  [FP-GRM21B-0_2-e0_2_0_7-IPC_A]  (hidden comment: GRM21BZ7YA475KE15K)
C23  Parameter 1: 0.1uF  [FP-GRM155-0_05-MFG]  (hidden comment: GRM155R71H104KE14D)
C24  Parameter 1: 4.7uF  [FP-GRM21B-0_2-e0_2_0_7-IPC_A]  (hidden comment: GRM21BZ7YA475KE15K)
C27  value 220uF  [FP-ZAG-MFG]  (hidden comment: EEH-ZA1V221P)
C30  Parameter 1: 0.1uF  [FP-GRM155-0_05-MFG]  (hidden comment: GRM155R71H104KE14D)
C31  Capacitance: 47uF  [FP-GRM31C-0_3-IPC_C]  (hidden comment: GRM31CR61E476ME44L)
C32  Capacitance: 47uF  [FP-GRM31C-0_3-IPC_C]  (hidden comment: GRM31CR61E476ME44L)
D1  SM0805YCL  [FP-SM0805YCL-MFG]
D2  SM0805YCL  [FP-SM0805YCL-MFG]
D4  MBR120VLSFT1G  [ONSC-SOD-123FL-2-498-01_V]
D5  Device Class L2: TVS Diodes  [FP-SMA-MFG]  (hidden comment: SMAJ15A)
D6  MBR120VLSFT1G  [ONSC-SOD-123FL-2-498-01_V]
J1  691214110002  [691214110002]
L1  value 4.7uH  [IND_SRP4020TA4R7M]  (hidden comment: SRP4020TA4R7M)
R11  CRCW20101K60FKEF  [RESC5025X70N]
R12  value 470Ω  [FP-AC0805-MFG]  (hidden comment: AC0805FR-07470RL)
R17  Resistance: 100kR  [FP-RC0805-0_6-IPC_C]  (hidden comment: RC0805FR-07100KL)
U1  AP63205WU-7  [FP-TSOT26-MFG]
U3  TLV75733PDBVR  [FP-DBV0005A-MFG]

### Blocks framed on the sheet
POWER MOTOR 12V: C12 C14-C18 C20 C27 D1 D5 J1 R11
ESP32 VBUS POWER 5V-3V: C19 C21 C22 C24 D2 D4 D6 R12 U3

### Ports
3V3 (out, see MOD_DRV[4E], ESP32_module[4E]), GND (see MOD_DRV[4E], DRV8876[1C], ESP32_module[4E]), V_MOT (out, see MOD_DRV[4E], DRV8876[1C]), VBUS (see MOD_DRV[4E], ESP32_module[4E])

### Nets
3V3: C19.1 C24.1 D2.1(A) U3.5(OUT) ; port 3V3
+5: C31.1 C32.1 D6.2(A) L1.2 U1.1(FB)
GND: C7.2 C8.2 C12.2 C14.2 C15.2 C16.2 C17.2 C18.2 C19.2 C20.2 C21.2 C22.2 C24.2 C27.1(C) C30.2 C31.2 C32.2 D5.2(A) J1.2 R11.1 R12.2 U1.4(GND) U3.2(GND) ; port GND
V_MOT: C7.1 C8.1 C12.1 C14.1 C15.1 C16.1 C17.1 C18.1 C20.1 C27.2(A) C30.1 D1.1(A) D5.1(C) J1.1 R17.2 U1.3(VIN) ; port V_MOT
VBUS: D4.2(A) ; port VBUS
5V_sys: C21.1 C22.1 D4.1(K) D6.1(K) U3.1(IN) U3.3(EN)
NetC23_1: C23.1 U1.6(BST)
NetC23_2: C23.2 L1.1 U1.5(SW)
NetD1_2: D1.2(C) R11.2
NetD2_2: D2.2(C) R12.1
NetR17_1: R17.1 U1.2(EN)

Not connected (* = marked no-connect by the designer): U3 4(NC)*

### Notes on the sheet
- MÓDULO REDUCTOR DE VOLTAJE BUCK
- DWG. NO.
- REV.
- SHT.
- THIS DOCUMENT AND THE DATA DISCLOSED HEREIN OR HEREWITH IS THE PROPERTY OF ALTIUM LIMITED AND MAY BE FREELY DISTRIBUTED IN WHOLE. NO RIGHTS ARE RESERVED OR EXPRESS OR IMPLIED WARANTEE GIVEN.
- REVISION
- DESCRIPTION
- DATE
- APPROVED
- ENG:
- DSN:
- APPROVALS
- PROJECT REVISION:
- www.altium.com <http://www.altium.com>
- DOCUMENT REVISION:
- 92037, La Jolla
- USA
- Altium Ltd.
- 4225 Executive Square
- CHK:
- REFERENCE DOCUMENTS
- DESIGN ITEM:
- TITLE
- VARIANT
- BOM:
- FAB DWG:
- PCB DWG:
- ASSY DWG:
- SCALE:
- SIZE
- B
- CAGE CODE
- FILE NAME
- DWG NO.
- SHEET
- OF
- REV
- (in symbol CMP-05428-000011-1) +

### Library data of the parts
C7 C8 C12 C14-C22 C24 = CMP-06035-048385-1: as C10 on sheet ESP32_module
C23 C30 = CMP-06035-062118-1: as C25 on sheet ESP32_module; RoHS Compliant: Yes
C27 = CMP-05428-000011-1: HYBRID SMD 35V220UF 105DEGC 1000; Manufacturer: Panasonic; Ripple Current: 2500mA; Leakage Current: 77uA; Material: Polymer; Tolerance: 20%; Esr: 20mΩ; Automotive Grade: Grade 2; Life: 10000Hours; Dissipation Factor: 12%; Voltage Rating: 35V; Octopart: https://octopart.com/eeh-za1v221p-panasonic-103134281; Temperature: -55°C to +105°C; ComponentLink2URL: https://b2b-api.panasonic.eu/file_stream/pids/fileversion/41; Device Class L2: Capacitors; Mouser Description: Capacitor Aluminum Polymer 220uF 20% 35V 2-Pin Surface Mount Paper T/R; Temperature Range High: +105°C; Automotive: Yes; RoHS: TRUE; Capacitance: 220uF; Height: 10.5mm; Manufacturer Part Number: EEH-ZA1V221P; Lead Free: Yes; Package: ZAG; Footprint Url: https://b2b-api.panasonic.eu/file_stream/pids/fileversion/37; Digikey Description: HYBRID SMD 35V220UF 105DEGC 1000; Device Class L1: Passive Components; Device Class L3: Polymer Capacitors; Category: Cap; ComponentLink2Description: Datasheet; Temperature Range Low: -55°C
C31 C32 = CMP-06035-000147-1: CAP CER 47UF 25V X5R 1206; Tolerance: 20%; Width: 1.6mm; Dielectric: X5R; Thickness: 1.6mm; Length: 3.2mm; Voltage Rating (DC): 25V
D1 D2 = CMP-35283-000007-1: LED YELLOW CLEAR 0805 SMD; Luminous Intensity: 11.5mcd; Test Current: 2mA; Viewing Angle: 130°; Dominant Wavelength: 592nm; Forward Voltage: 1.9V; Lens Color: Colorless; Case Code (Metric): 2012; Illumination Color: Yellow; Length: 2mm; Max Operating Temperature: 80°C; Width: 1.2mm; Case Code (Imperial): 0805; Packaging: Tape and Reel; Lens Transparency: Clear; Mount: Surface Mount; Case/Package: 0805; Forward Current: 2mA; Height: 0.8mm; Lead Free: Lead Free; Min Operating Temperature: -30°C; Color: Yellow; Package Quantity: 4000
D4 D6 = CMP-1055-00449-1: Schottky Power Rectifier, 2-Pin SOD-123, Pb-Free, Tape and Reel; Manufacturer: On Semiconductor; IFSM Max (A): 45; Configuration: Single; PackageDescription: 2-Pin SOD, Body 1.65 x 2.7 mm; RoHS: TRUE; ComponentLink2URL: http://www.onsemi.cn/pub_link/Collateral/MBR120VLSFT1-D.PDF; Mounting Technology: Surface Mount; ComponentLink1Description: Manufacturer URL; DatasheetVersion: Rev. 2; ComponentLink3Description: Package Specification; Packing: Tape and Reel; ComponentLink2Description: Datasheet; ComponentLink1URL: http://www.onsemi.com/; PackageVersion: Rev. A; PackageReference: SOD-123FL-2-498-01; ComponentLink3URL: http://www.onsemi.cn/pub_link/Collateral/MBR120VLSFT1-D.PDF; PartNumber: MBR120VLSFT1G
D5 = CMP-07401-000026-1: TVS DIODE 15V 24.4V SMA; Manufacturer: Bourns Inc.; Description: 24.4V Clamp 16.4A Ipp Tvs Diode Surface Mount SMA (DO-214AC); Max Junction Temp: +150°C; Peak Pulse Current: 16.4A; Direction: Unidirectional; Breakdown Voltage: 16.7V; Number Of Channels: 1; Peak Pulse Power: 400W; Mouser Description: Bourns Smaj15a / Diode Tvs 15v 400w Uni 5% Smd Bourns; Temperature Range Low: -55°C; ComponentLink2Description: Datasheet; Package: SMA; Reverse Standoff Voltage: 15V; Category: Diode; Lead Free: Yes; RoHS: TRUE; Clamping Voltage: 24.4V; ComponentLink2URL: https://www.bourns.com/docs/Product-Datasheets/SMAJ.pdf; Digikey Description: TVS DIODE 15V 24.4V SMA; Temperature Range High: +150°C; Height: 2.29mm; Device Class L1: Circuit Protection; Device Class L3: unset; Temperature: -55°C to +150°C; Octopart: https://octopart.com/smaj15a-bourns-12809353; Manufacturer Part Number: SMAJ15A; Automotive: No
J1 = CMP-1502-02464-3: 2141 Series 3.5MM Pitch Straight, Pcb Terminal Block, Through Hole, 2 Way; Plating: Brass, Steel; Wire Gauge (Min): 16AWG; Number of Contacts: 2; Current: 10A; Stripping Length: -6mm; Voltage Rating: 300V; Pitch: 3.5052mm; Wire Gauge (Max): 24AWG; Number of Levels: 1; Lead Pitch: 3.5mm; Width: 7.9mm; Packaging: Box; RoHS: Compliant; Number of Rows: 1; Min Operating Temperature: -40°C; Mount: Through Hole; Number of Pins: 2; Contact Plating: Brass, Tin; Housing Material: Nylon; Current Rating: 10A; Termination: Screw; Color: Blue, Green; Number of Positions Per Level: 2; Height: 8.7mm; Voltage: 300V; Max Operating Temperature: 105°C; Wire/Cable Gauge: 24AWG; Length: 7.4mm; Contact Material: Tin
L1 = SRP4020TA4R7M: Inductor Power Shielded Wirewound 4.7uH 20% 100KHz 10Q-Factor Carbonyl Powder 2.6A 0.105Ohm DCR 1616 Automotive T/R; MF: Bourns; Availability: In Stock; Check_prices: https://www.snapeda.com/parts/SRP4020TA4R7M/Bourns/view-part/?ref=eda; Package: None; Price: None; Purchase-URL: https://pricing.snapeda.com/search/part/SRP4020TA4R7M/?ref=eda; SnapEDA_Link: https://www.snapeda.com/parts/SRP4020TA4R7M/Bourns/view-part/?ref=snap; MP: SRP4020TA4R7M
R11 = CRCW20101K60FKEF: 1.6 kOhms Â±1% 0.75W, 3/4W Chip Resistor 2010 (5025 Metric) Automotive AEC-Q200 Thick Film; MF: Vishay; SnapEDA_Link: https://www.snapeda.com/parts/CRCW20101K60FKEF/Vishay/view-part/?ref=snap; Package: 5025 Vishay; Value: *; MP: CRCW20101K60FKEF; Check_prices: https://www.snapeda.com/parts/CRCW20101K60FKEF/Vishay/view-part/?ref=eda
R12 = CMP-03412-037267-1: as R6 on sheet ESP32_module; Package: AC0805; Device Class L3: Chip SMD Resistors; Composition: Thick Film; Ipc Land Pattern Name: RESC200125X50; Height: 0.6mm; Device Class L1: Passive Components; Series: AC; Resistance: 470Ω; RoHS: TRUE; Automotive: Yes; ComponentLink2Description: Datasheet; Power Rating: 1/8W; Temperature Range Low: -55°C; Category: Res; Digikey Description: RES SMD 470 OHM 1% 1/8W 0805; Temperature: -55°C to +155°C; ComponentLink2URL: http://www.yageo.com/documents/recent/PYu-AC_51_RoHS_L_6.pdf; Manufacturer Part Number: AC0805FR-07470RL; Mouser Description: Thick Film Resistors 1/8W 470ohm 1% AEC-Q200; Lead Free: Yes; Temperature Range High: +155°C; Device Class L2: Resistors; Octopart: https://octopart.com/ac0805fr-07470rl-yageo-26633242; Footprint Url: http://www.yageo.com/exep/pages/download/literatures/PYu-R_Mount_10.pdf
R17 = CMP-2100-03668-5: RES 100K OHM 1% 1/8W 0805; Power Rating: 125mW; Temperature Coefficient: 100ppm/°C; Voltage Rating (DC): 150V; Package Quantity: 1; Case/Package: 0805; Lead Pitch: 0.4mm; Case Code (Imperial): 0805; Construction: Rectangular; Number of Terminations: 2; RoHS Compliant: Yes; Max Power Dissipation: 125mW; Tolerance: 1%; Max Operating Temperature: 155°C; Resistance Tolerance: 1%; Lead Free: Lead Free; Packaging: Tape and Reel; Resistor Type: Thick Film; Min Operating Temperature: -55°C; Case Code (Metric): 2012; Series: RC; Technology: THICK FILM; Voltage Rating: 150V; Termination: SMD/SMT; Width: 0.049inch; Number of Pins: 2; Features: Moisture Resistant; Military Standard: Not; Length: 0.079inch; Depth: 1.25mm; Size Code: 0805; Height: 0.024inch
U1 = CMP-12757-000001-1: IC REG BUCK 5V 2A TSOT26; Manufacturer: Diodes Inc.; Max Junction Temp: +160°C; Max Duty Cycle: 100%; Standoff Height: 0.01mm; Max Supply Voltage: 32V; Number Of Outputs: 1; Description: Buck Switching Regulator IC Positive Fixed 5V 1 Output 2A SOT-23-6 Thin, TSOT-23-6; Min Supply Voltage: 3.8V; Output Type: Fixed; Switching Frequency: 1100kHz; Nominal Supply Current: 22uA; Automotive: No; RoHS: TRUE; Switching Topology: Buck; Temperature: -40°C to +85°C; Footprint Url: https://www.diodes.com/assets/Package-Files/TSOT26.pdf; Lead Free: Yes; Digikey Description: IC REG BUCK 5V 2A TSOT26; Device Class L3: Voltage Regulators - Switching; Ambient Temperature Range High: +85°C; Category: IC; Package: TSOT26; Output Voltage: 5V; Output Current: 2A; ComponentLink2Description: Datasheet; Device Class L2: Power Management ICs; Ambient Temperature Range Low: -40°C; Temperature Range High: +85°C; Temperature Range Low: -40°C; Octopart: https://octopart.com/ap63205wu-7-diodes+inc.-98099551; Manufacturer Part Number: AP63205WU-7; Height: 1mm; Device Class L1: Integrated Circuits (ICs); ComponentLink2URL: https://www.diodes.com/assets/Datasheets/AP63200-AP63201-AP63203-AP63205.pdf
U3 = CMP-04917-000028-1: IC REG LINEAR 3.3V 1A SOT23-5; Manufacturer: Texas Instruments; Standoff Height: 0mm; Description: Linear Voltage Regulator IC 1 Output 1A SOT-23-5; Min Supply Voltage: 1.45V; Dropout Voltage: 1350mV; Output Type: Fixed; Max Junction Temp: +125°C; Max Supply Voltage: 5.5V; Number Of Outputs: 1; Accuracy Percentage: 1%; Manufacturer Part Number: TLV75733PDBVR; ComponentLink2Description: Datasheet; Temperature: -40°C to +125°C; RoHS: TRUE; ComponentLink2URL: http://www.ti.com/lit/ds/symlink/tlv757p.pdf; Output Voltage: 3.3V; Mouser Description: 1-A low-IQ small-size low-dropout (LDO) regulator 5-SOT-23 -40 to 125; Ipc Land Pattern Name: SOT95P280X145-5; Device Class L2: Power Management ICs; Package: DBV0005A; Height: 1.45mm; Category: IC; Digikey Description: IC REG LINEAR 3.3V 1A SOT23-5; Temperature Range High: +125°C; Octopart: https://octopart.com/tlv75733pdbvr-texas+instruments-91437073; Temperature Range Low: -40°C; Device Class L3: Voltage Regulators - Linear; Output Current: 1A; Device Class L1: Integrated Circuits (ICs); Automotive: No; Lead Free: Yes

## Sheet CAN.SchDoc
size A4; SheetNumber: 4; SheetTotal: 5
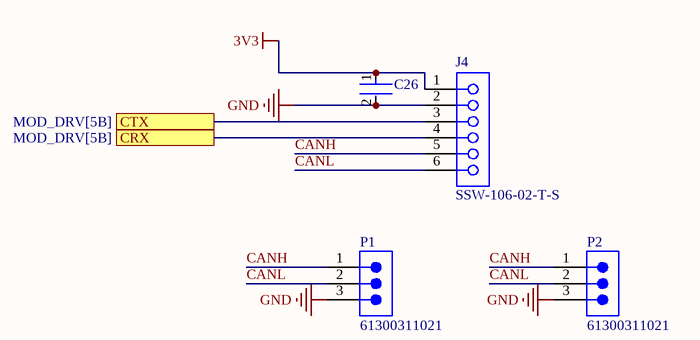
[diagram p4: CAN.SchDoc]

### Parts
C26  GCD21BR72A104MA01L  [FP-GCD21B-0_15-MFG]  (value not drawn)
J4  SSW-106-02-T-S  [SMTC-SSW-106-02-X-S]
P1  61300311021  [61300311021]
P2  61300311021  [61300311021]

### Ports
CRX (see MOD_DRV[5B]), CTX (see MOD_DRV[5B])

### Nets
3V3: C26.1 J4.1
GND: C26.2 J4.2 P1.3 P2.3
CANH: J4.5 P1.1 P2.1
CANL: J4.6 P1.2 P2.2
IO21: J4.3 ; port CTX
IO22: J4.4 ; port CRX

### Library data of the parts
C26 = CMP-06035-062053-1: Chip Multilayer Ceramic Capacitors for Automotive, 0805, 0.10uF, X7R, 15%, 20%, 100V, Grade 1
J4 = CMP-1023-00360-1: SQ Post Socket, Through-hole, Vertical, -55 to 105 degC, 2.54mm Pitch, 6-Pin, Female, RoHS; Manufacturer: Samtec; ComponentLink1URL: http://www.samtec.com; Temperature Range: -55 to 105 degC; Pitch: 2.54 mm; Mounting Technology: Through-hole; DatasheetVersion: F-214; ComponentLink1Description: Manufacturer URL; PackageVersion: CA, 6/1987; ComponentLink3Description: Package Specification; PackageDescription: Assembly, Socket Strip .016 X .031 Tail; ComponentLink2Description: Datasheet; ComponentLink2URL: http://www.samtec.com/documents/webfiles/pdf/SSW_TH.PDF; PackageReference: SSW-106-02-X-S; ComponentLink3URL: http://www.samtec.com/documents/webfiles/cpdf/SSW-1XX-XX-XXX-X-XX-XXX-XX-MKT.pdf; RoHS: True; PartNumber: SSW-106-02-T-S; Orientation: Vertical
P1 P2 = CMP-1502-01061-4: THT Angled Pin Header WR-PHD, Pitch 2.54 mm, Single Row, 3 pins; Contact Resistance: 20mΩ; Number of Positions: 3; Operating Supply Voltage: 250V; Connector Type: Male Pin; Gender: Male; Current Rating: 3A; Pitch: 2.54mm; Number of Pins: 3; Lead Pitch: 2.54mm; Mount: Through Hole; Contact Material: Copper; Contact Plating: Gold; Color: Black; Number of Contacts: 3; Packaging: Bulk; Contact Mating Length: 5.9944mm; Number of Rows: 1; Termination: Solder; RoHS: Compliant

## Nets that join several sheets
3V3: ESP32_module (11 pins), DRV_3 (5 pins), DRV_2 (5 pins), DRV_1 (5 pins), PowerSupply (C19.1 C24.1 D2.1 U3.5), CAN (C26.1 J4.1)
GND: ESP32_module (26 pins), DRV_3 (8 pins), DRV_2 (8 pins), DRV_1 (8 pins), PowerSupply (23 pins), CAN (C26.2 J4.2 P1.3 P2.3)
V_MOT: DRV_3 (C1C.2 C2C.1 C3C.1 DRVC.11), DRV_2 (C1B.2 C2B.1 C3B.1 DRVB.11), DRV_1 (C1A.2 C2A.1 C3A.1 DRVA.11), PowerSupply (16 pins)
VBUS: ESP32_module (6 pins), PowerSupply (D4.2)
IO2: ESP32_module (MD1.24), DRV_3 (DRVC.2)
IO4: ESP32_module (MD1.26), DRV_3 (EncoderC.4)
IO5: ESP32_module (MD1.29), DRV_1 (DRVA.4 R4A.2)
IO13: ESP32_module (MD1.16), DRV_3 (EncoderC.6)
IO14: ESP32_module (MD1.13), DRV_2 (DRVB.4 R4B.2)
IO15: ESP32_module (MD1.23), DRV_3 (DRVC.4 R4C.2)
IO16: ESP32_module (MD1.27), DRV_3 (DRVC.1)
IO17: ESP32_module (MD1.28), DRV_2 (EncoderB.6)
IO18: ESP32_module (MD1.30), DRV_2 (DRVB.1)
IO19: ESP32_module (MD1.31), DRV_2 (DRVB.2)
IO21: ESP32_module (MD1.33), CAN (J4.3)
IO22: ESP32_module (MD1.36), CAN (J4.4)
IO23: ESP32_module (MD1.37), DRV_2 (EncoderB.4)
IO25: ESP32_module (MD1.10), DRV_1 (EncoderA.6)
IO26: ESP32_module (MD1.11), DRV_1 (DRVA.1)
IO27: ESP32_module (MD1.12), DRV_1 (DRVA.2)
IO32: ESP32_module (MD1.8), DRV_1 (DRVA.6 R1A.2)
IO33: ESP32_module (MD1.9), DRV_2 (DRVB.6 R1B.2)
IO34: ESP32_module (MD1.6), DRV_3 (DRVC.6 R1C.2)
IO35: ESP32_module (MD1.7), DRV_1 (EncoderA.4)